# Altium project CMSIS-DAP_T8U6_PCB_Project.PrjPcb
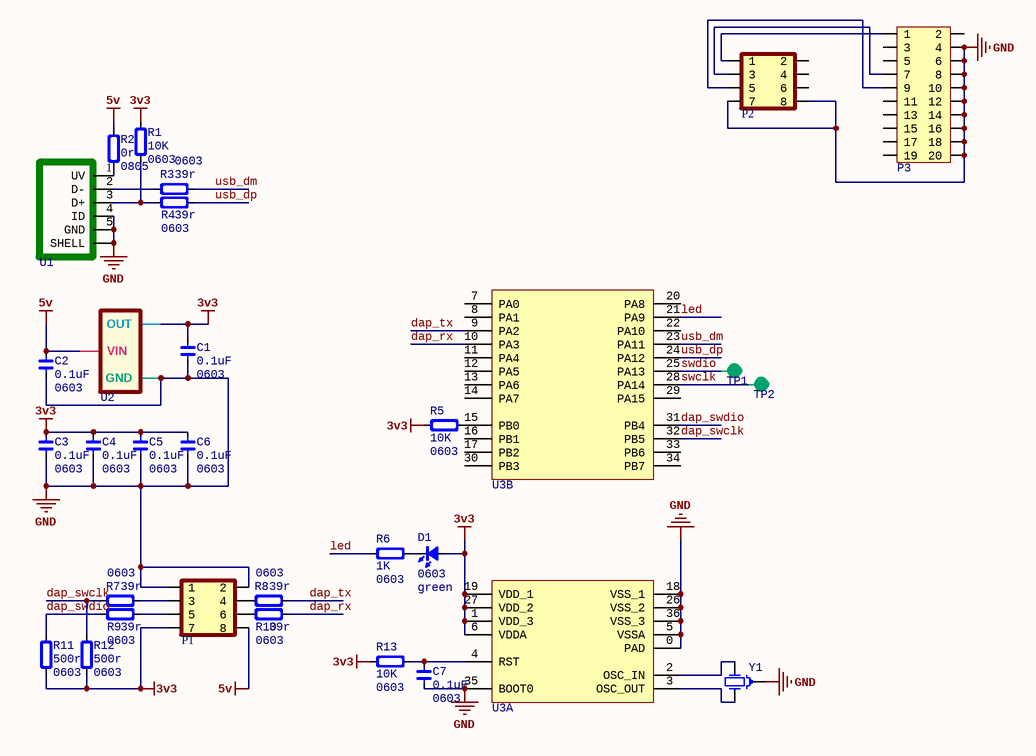
[diagram p0: Sheet1.SchDoc]
1 sheet, 30 parts. Net scope: global (net labels, ports and power ports of the same name join across sheets).
Board file: CMSIS-DAP-V2.PcbDoc

## Sheet Sheet1.SchDoc
size A4

### Parts
C1  value 0.1uF  Type: 0603  [CAP_0603]  (hidden comment: C0603)
C2  value 0.1uF  Type: 0603  [CAP_0603]  (hidden comment: C0603)
C3  value 0.1uF  Type: 0603  [CAP_0603]  (hidden comment: C0603)
C4  value 0.1uF  Type: 0603  [CAP_0603]  (hidden comment: C0603)
C5  value 0.1uF  Type: 0603  [CAP_0603]  (hidden comment: C0603)
C6  value 0.1uF  Type: 0603  [CAP_0603]  (hidden comment: C0603)
C7  value 0.1uF  Type: 0603  [CAP_0603]  (hidden comment: C0603)
D1  Type: 0603  [LED_0603_GREEN]  (hidden comment: green)
P1  HDR2x4_2.54  [HDR2X4_2.54_180H]  (value not drawn)
P2  HDR2x4_2.54  [HDR2X4_2.54_180HF]  (value not drawn)
P3  HDR2x10_2.54  [HDR2X10_2.54_90]  (value not drawn)
R1  value 10K  Type: 0603  [RES_0603]  (hidden comment: R0603)
R2  value 0r  Type: 0805  [RES_0805]  (hidden comment: R0805)
R3  value 39r  Type: 0603  [RES_0603]  (hidden comment: R0603)
R4  value 39r  Type: 0603  [RES_0603]  (hidden comment: R0603)
R5  value 10K  Type: 0603  [RES_0603]  (hidden comment: R0603)
R6  value 1K  Type: 0603  [RES_0603]  (hidden comment: R0603)
R7  value 39r  Type: 0603  [RES_0603]  (hidden comment: R0603)
R8  value 39r  Type: 0603  [RES_0603]  (hidden comment: R0603)
R9  value 39r  Type: 0603  [RES_0603]  (hidden comment: R0603)
R10  value 39r  Type: 0603  [RES_0603]  (hidden comment: R0603)
R11  value 500r  Type: 0603  [RES_0603]  (hidden comment: R0603)
R12  value 500r  Type: 0603  [RES_0603]  (hidden comment: R0603)
R13  value 10K  Type: 0603  [RES_0603]  (hidden comment: R0603)
TP1  TP  [TP]  (value not drawn)
TP2  TP  [TP]  (value not drawn)
U1  USB-MICROUSB  [USB_Plug_TypeA_PCB]  (value not drawn)
U2  xc6206  [XC6206]  (value not drawn)
U3  STM32F103T  [QFN_P0.5_36]  (value not drawn)  (parts A,B of 2)
Y1  XTAL-3PIN  [XTAL-3PIN]  (value not drawn)

### Nets
3v3: C1.1 C3.1 C4.1 C5.1 C6.1 D1.1(A) P1.7 R1.1 R5.1 R11.1 R12.1 R13.1 U2.3(OUT) U3.1(VDD_3) U3.6(VDDA) U3.19(VDD_1) U3.27(VDD_2)
5v: C2.1 P1.8 R2.2 U2.1(VIN)
GND: C1.2 C2.2 C3.2 C4.2 C5.2 C6.2 C7.1 P1.1 P1.2 P2.7 P2.8 P3.4 P3.6 P3.8 P3.10 P3.12 P3.14 P3.16 P3.18 P3.20 U1.0(SHELL) U1.4(ID) U1.5(GND) U2.2(GND) U3.0(PAD) U3.5(VSSA) U3.18(VSS_1) U3.26(VSS_2) U3.35(BOOT0) U3.36(VSS_3) Y1.2(GND)
dap_rx: R10.2 U3.10(PA3)
dap_swclk: R7.1 R12.2 U3.32(PB5)
dap_swdio: R9.1 R11.2 U3.31(PB4)
dap_tx: R8.2 U3.9(PA2)
led: R6.1 U3.21(PA9)
swclk: TP2.1 U3.28(PA14)
swdio: TP1.1 U3.25(PA13)
usb_dm: R3.2 U3.23(PA11)
usb_dp: R4.2 U3.24(PA12)
NetC7_2: C7.2 R13.2 U3.4(RST)
NetD1_2: D1.2(K) R6.2
NetP1_3: P1.3 R7.2
NetP1_4: P1.4 R8.1
NetP1_5: P1.5 R9.2
NetP1_6: P1.6 R10.1
NetP2_1: P2.1 P3.1
NetP2_3: P2.3 P3.7
NetP2_5: P2.5 P3.9
NetR1_2: R1.2 R4.1 U1.3(D+)
NetR2_1: R2.1 U1.1(UV)
NetR3_1: R3.1 U1.2(D-)
NetR5_2: R5.2 U3.15(PB0)
NetU3_2: U3.2(OSC_IN) Y1.3(OSC2)
NetU3_3: U3.3(OSC_OUT) Y1.1(OSC1)

Not connected (* = marked no-connect by the designer): P2 2 4 6; P3 2 3 5 11 13 15 17 19; U3 7(PA0) 8(PA1) 11(PA4) 12(PA5) 13(PA6) 14(PA7) 16(PB1) 17(PB2) 20(PA8) 22(PA10) 29(PA15) 30(PB3) 33(PB6) 34(PB7)

### Notes on the sheet
- (in symbol LED-RGB-3030) .

### Library data of the parts
C1-C7 = Cap_0603: Capacitor; Specification: X7R 50V; Manufacturer: *
D1 = LED_0603: LED; Value: green
P1 P2 = HDR2x4_2.54: Header
P3 = HDR2x10_2.54: Header
R1 R3-R13 = Res_0603: Resistor; Specification: ±5%; Manufacturer: *
R2 = Res_0805: Resistor; Specification: ±5%; Manufacturer: *
U2 = DC-XC6206
U3 = STM32F103T: MCU; Type: QFN36 P0.5
Y1 = XTAL-3PIN: murata CSTCE 8M 3.2*1.3